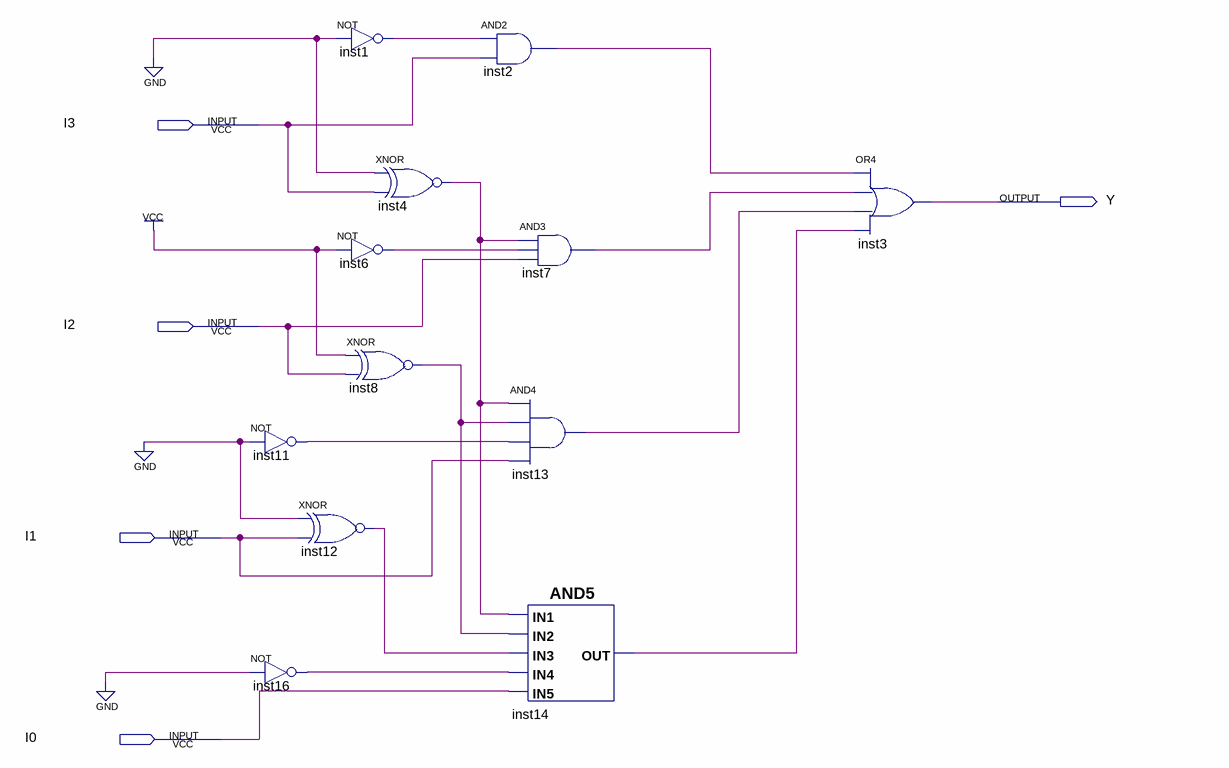
[diagram p0: schematic sheet]
// Quartus schematic BIGGERTHAN4.bdf as structural Verilog: 12 symbols, 5 pins
module BIGGERTHAN4 (
  input  I3,
  input  I2,
  input  I1,
  input  I0,
  output Y
);

  wire inst1_out, inst2_out, inst4_out, inst6_out, inst7_out, inst8_out, inst11_out, inst12_out, inst13_out,
       inst14_out, inst16_out;

  not inst11 (inst11_out, 1'b0);
  xnor inst12 (inst12_out, 1'b0, I1);
  not inst16 (inst16_out, 1'b0);
  not inst1 (inst1_out, 1'b0);
  xnor inst4 (inst4_out, 1'b0, I3);
  not inst6 (inst6_out, 1'b1);
  xnor inst8 (inst8_out, 1'b1, I2);
  and inst2 (inst2_out, inst1_out, I3);
  and inst7 (inst7_out, inst4_out, inst6_out, I2);
  and inst13 (inst13_out, inst4_out, inst8_out, inst11_out, I1);
  and inst14 (inst14_out, inst4_out, inst8_out, inst12_out, inst16_out, I0);
  or inst3 (Y, inst2_out, inst7_out, inst13_out, inst14_out);
endmodule
